# Altium schematic sheet CANable.SchDoc
size A4; SheetNumber: 1; SheetTotal: 1
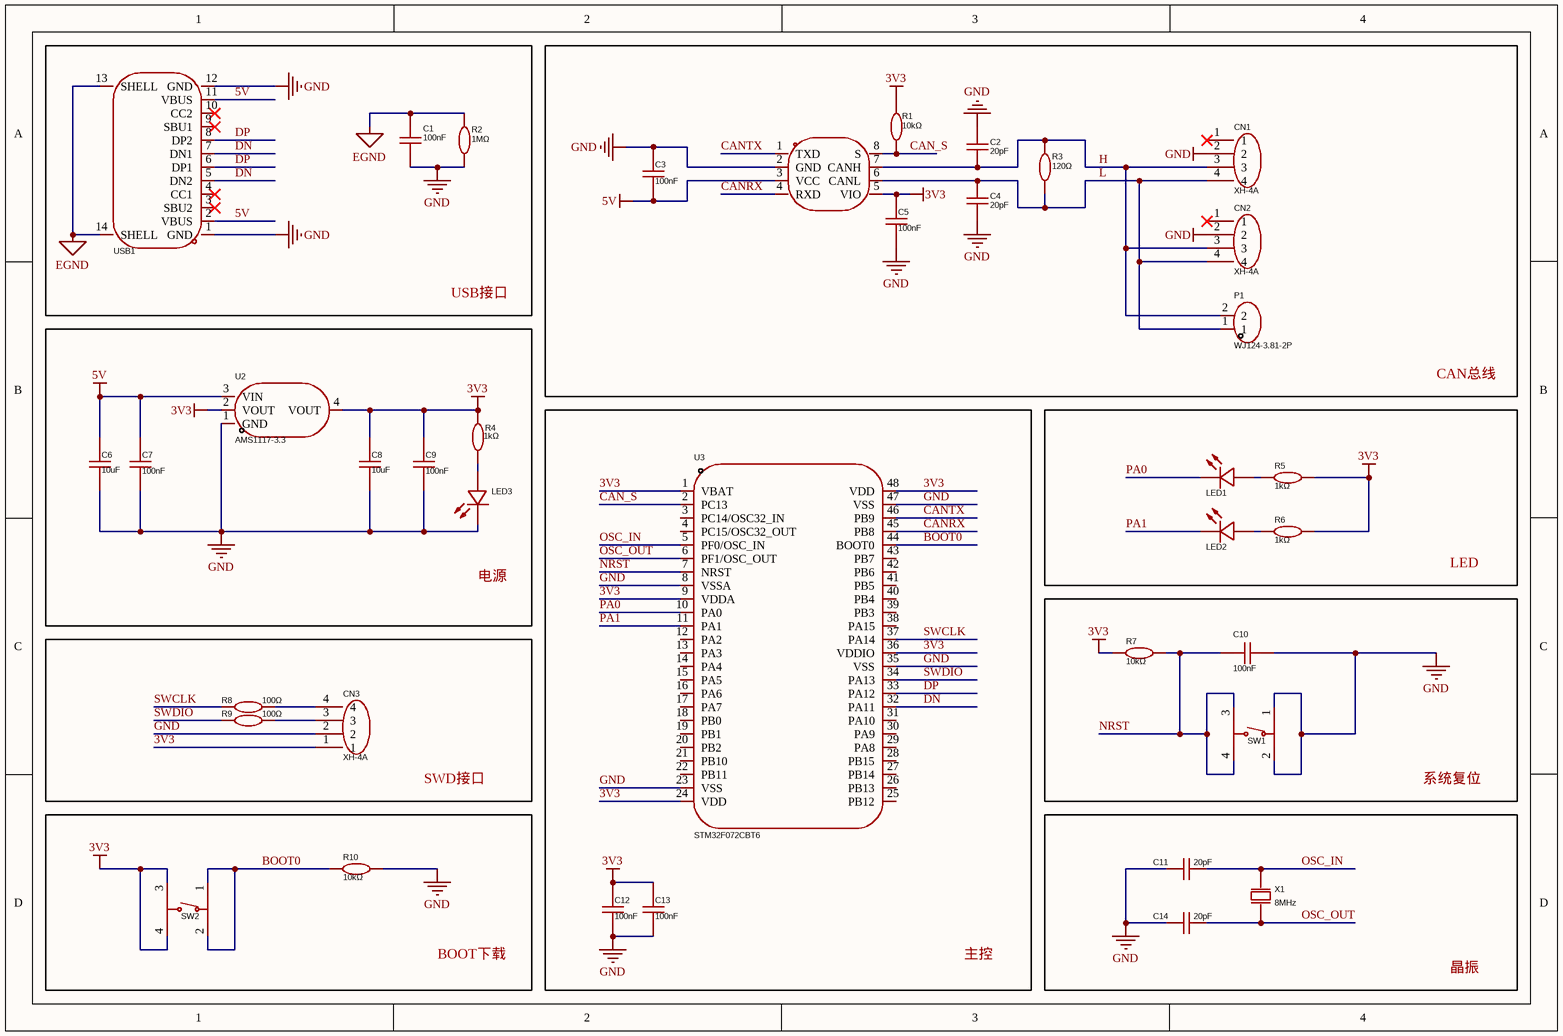
[diagram p0: CANable.SchDoc]

## Parts
C1  100nF  [C0603]
C2  20pF  [C0603]
C3  100nF  [C0603]
C4  20pF  [C0603]
C5  100nF  [C0603]
C6  10uF  [C0805]
C7  100nF  [C0603]
C8  10uF  [C0805]
C9  100nF  [C0603]
C10  100nF  [C0603]
C11  20pF  [C0603]
C12  100nF  [C0603]
C13  100nF  [C0603]
C14  20pF  [C0603]
CN1  XH-4A  [CONN-TH_4P-P2.50_XH-4A]
CN2  XH-4A  [CONN-TH_4P-P2.50_XH-4A]
CN3  XH-4A  [CONN-TH_4P-P2.50_XH-4A]
LED1  KT-0603R  [LED0603-RD]  (value not drawn)
LED2  KT-0603R  [LED0603-RD]  (value not drawn)
LED3  KT-0603R  [LED0603-RD]  (value not drawn)
P1  WJ124-3.81-2P  [CONN-TH_2P-P3.81_KF124-3.81-2P]
R1  10kΩ  [R0603]
R2  1MΩ  [R0603]
R3  120Ω  [R0603]
R4  1kΩ  [R0603]
R5  1kΩ  [R0603]
R6  1kΩ  [R0603]
R7  10kΩ  [R0603]
R8  100Ω  [R0603]
R9  100Ω  [R0603]
R10  10kΩ  [R0603]
SW1  TS-1187A-B-A-B  [SW-SMD_4P-L5.1-W5.1-P3.70-LS6.5-TL_H1.5]  (value not drawn)
SW2  TS-1187A-B-A-B  [SW-SMD_4P-L5.1-W5.1-P3.70-LS6.5-TL_H1.5]  (value not drawn)
U1  TJA1051T/3/1J  [SOIC-8_L4.9-W3.9-P1.27-LS6.0-BL]  (value not drawn)
U2  AMS1117-3.3  [SOT-223-3_L6.5-W3.4-P2.30-LS7.0-BR]
U3  STM32F072CBT6  [LQFP-48_L7.0-W7.0-P0.50-LS9.0-BL]
USB1  TYPE-C 16PIN 2MD(073)  [USB-C-SMD_TYPE-C-6PIN-2MD-073]  (value not drawn)
X1  8MHz  [CRYSTAL-SMD_L5.0-W3.2]

## Blocks framed on the sheet
USB接口: C1 R2 USB1
CAN总线: C2-C5 CN1 CN2 P1 R1 R3 U1
电源: C6-C9 LED3 R4 U2
主控: C12 C13 U3
LED: LED1 LED2 R5 R6
系统复位: C10 R7 SW1
SWD接口: CN3 R8 R9
BOOT下载: R10 SW2
晶振: C11 C14 X1

## Nets
3V3: C5.1 C8.1 C9.1 C12.1 C13.1 CN3.1 R1.2 R4.1 R5.1 R6.1 R7.1 SW2.3(C) SW2.4(D) U1.5(VIO) U2.2(VOUT) U2.4(VOUT) U3.1(VBAT) U3.9(VDDA) U3.24(VDD) U3.36(VDDIO) U3.48(VDD)
5V: C3.2 C6.1 C7.1 U1.3(VCC) U2.3(VIN) USB1.2(VBUS) USB1.11(VBUS)
EGND: C1.1 R2.1 USB1.13(SHELL) USB1.14(SHELL)
GND: C1.2 C2.2 C3.1 C4.1 C5.2 C6.2 C7.2 C8.2 C9.2 C10.2 C11.1 C12.2 C13.2 C14.1 CN1.2 CN2.2 CN3.2 LED3.1(K) R2.2 R10.2 SW1.1(A) SW1.2(B) U1.2(GND) U2.1(GND) U3.8(VSSA) U3.23(VSS) U3.35(VSS) U3.47(VSS) USB1.1(GND) USB1.12(GND)
BOOT0: R10.1 SW2.1(A) SW2.2(B) U3.44(BOOT0)
CAN_S: R1.1 U1.8(S) U3.2(PC13)
CANRX: U1.4(RXD) U3.45(PB8)
CANTX: U1.1(TXD) U3.46(PB9)
DN: U3.32(PA11) USB1.5(DN2) USB1.7(DN1)
DP: U3.33(PA12) USB1.6(DP1) USB1.8(DP2)
H: C2.1 CN1.3 CN2.3 P1.2 R3.1 U1.7(CANH)
L: C4.2 CN1.4 CN2.4 P1.1 R3.2 U1.6(CANL)
NRST: C10.1 R7.2 SW1.3(C) SW1.4(D) U3.7(NRST)
OSC_IN: C11.2 U3.5(PF0/OSC_IN) X1.2(OSC2)
OSC_OUT: C14.2 U3.6(PF1/OSC_OUT) X1.1(OSC1)
PA0: LED1.1(K) U3.10(PA0)
PA1: LED2.1(K) U3.11(PA1)
SWCLK: R8.1 U3.37(PA14)
SWDIO: R9.1 U3.34(PA13)
NetCN3_3: CN3.3 R9.2
NetCN3_4: CN3.4 R8.2
NetLED1_2: LED1.2(A) R5.2
NetLED2_2: LED2.2(A) R6.2
NetLED3_2: LED3.2(A) R4.2

Not connected (* = marked no-connect by the designer): CN1 1*; CN2 1*; U3 3(PC14/OSC32_IN) 4(PC15/OSC32_OUT) 12(PA2) 13(PA3) 14(PA4) 15(PA5) 16(PA6) 17(PA7) 18(PB0) 19(PB1) 20(PB2) 21(PB10) 22(PB11) 25(PB12) 26(PB13) 27(PB14) 28(PB15) 29(PA8) 30(PA9) 31(PA10) 38(PA15) 39(PB3) 40(PB4) 41(PB5) 42(PB6) 43(PB7); USB1 3(SBU2)* 4(CC1)* 9(SBU1)* 10(CC2)*

## Library data of the parts
C1 C3 C5 C7 C9 C10 C12 C13 = CC0603KRX7R9BB104: Manufacturer: YAGEO(国巨); Add into BOM: yes; Tolerance: ±10%; Voltage Rating: 50V; Temperature Coefficient: X7R; Symbol: CC0603KRX7R9BB104; Device: CC0603KRX7R9BB104; LCSC Part Name: 100nF ±10% 50V; Supplier Part: C14663; Manufacturer Part: CC0603KRX7R9BB104; Supplier Footprint: 0603; JLCPCB Part Class: Basic Part; Datasheet: https://atta.szlcsc.com/upload/public/pdf/source/20250214/096C4C206003071F5D32E5F0D8E7F8DF.pdf; Supplier: LCSC; Convert to PCB: yes; Value: 100nF
C2 C4 C11 C14 = CL10C200JB8NNNC: Manufacturer: SAMSUNG(三星); Add into BOM: yes; Tolerance: ±5%; Voltage Rating: 50V; Temperature Coefficient: C0G; Symbol: CL10C200JB8NNNC; Device: CL10C200JB8NNNC; LCSC Part Name: 20pF ±5% 50V; Supplier Part: C1648; Manufacturer Part: CL10C200JB8NNNC; Supplier Footprint: 0603; JLCPCB Part Class: Basic Part; Datasheet: https://item.szlcsc.com/datasheet/CL10C200JB8NNNC/2000.html; Supplier: LCSC; Convert to PCB: yes; Value: 20pF
C6 C8 = CL21A106KAYNNNE_C15850: Manufacturer: SAMSUNG(三星); Add into BOM: yes; Tolerance: ±10%; Voltage Rated: 25V; Temperature Coefficient: X5R; Symbol: CL21A106KAYNNNE; Device: CL21A106KAYNNNE_C15850; LCSC Part Name: 10uF ±10% 25V; Supplier Part: C15850; Manufacturer Part: CL21A106KAYNNNE; Supplier Footprint: 0805; JLCPCB Part Class: Basic Part; Datasheet: https://atta.szlcsc.com/upload/public/pdf/source/20160218/1457707763339.pdf; Supplier: LCSC; Convert to PCB: yes; Value: 10uF
CN1-CN3 = XH-4A_C37815: Manufacturer: BOOMELE(博穆精密); Add into BOM: yes; Pins Structure: 1x4P; Pitch: 2.5mm; Reference Series: XH; Number of PINs Per Row: 4; Symbol: XH-4A; Device: XH-4A_C37815; LCSC Part Name: 1x4P 间距:2.5mm 直插 系列:XH; Supplier Part: C37815; Manufacturer Part: XH-4A; Supplier Footprint: 插件,P=2.5mm; JLCPCB Part Class: Extended Part; Datasheet: https://atta.szlcsc.com/upload/public/pdf/source/20181205/C146112_2CB31444E6250AC61E2A41A9A8391D5F.pdf; Supplier: LCSC; Convert to PCB: yes; Mounting Type: 直插; Number of Pins: 4P; Number of Rows: 1; Row Spacing: -; Current Rating: -; Contact Material: -; Contact Plating: -; Operating Temperature: -; Voltage Rating: -; Plastic Material: -; Flame Retardant Rating: -; Supplementary Features: -; Color: -; Z-Height of the Board: -; X-Length of Bottom Edge on Board (Spacing Line): -; Y-Width of Bottom Edge on Board: -
LED1-LED3 = KT-0603R: Manufacturer: KENTO; Add into BOM: yes; Emitted Color: 红色; Symbol: KT-0603R; Device: KT-0603R; LCSC Part Name: 0603 红灯 高亮; Supplier Part: C2286; Manufacturer Part: KT-0603R; Supplier Footprint: 0603; JLCPCB Part Class: Basic Part; Datasheet: https://atta.szlcsc.com/upload/public/pdf/source/20160616/1466072038404.pdf; Supplier: LCSC; Convert to PCB: yes; Power Dissipation: -; Forward Current: -; Dominant Wavelength: -; Peak Wavelength: -; Diode Configuration: -; Lens Color: -; Color Temperature: -; Viewing Angle: -; Mounting Sytle: -; Operating Temperature: -40℃~+85℃
P1 = WJ124-3.81-2P: Manufacturer: KANGNEX(康奈克斯电气); Add into BOM: yes; Structure: 1x2P; Pitch: 3.81mm; Current Rating (Max): 15A; Voltage Rating (Max): 300V; Wire Gauge - AWG: 14~30; Wire Gauge - mm2: 1.5; Number of PINs Per Row: 2; Symbol: WJ124-3.81-2P; Device: WJ124-3.81-2P; LCSC Part Name: 3.81mm 1x2P 排数:1 每排P数:2 直插; Supplier Part: C69811; Manufacturer Part: WJ124-3.81-2P; Supplier Footprint: 插件,P=3.81mm; JLCPCB Part Class: Extended Part; Datasheet: https://atta.szlcsc.com/upload/public/pdf/source/20191225/C69811_9330EF2523583BB8A7E3F75AE744BFE0.pdf; Supplier: LCSC; Convert to PCB: yes; Color: 绿色; Mounting Style: 直插; Number of Pins: 2P; Number of Rows: 1; Operating Temperature Range: -40℃~+105℃
R1 R7 R10 = 0603WAF1002T5E: Manufacturer: UNI-ROYAL(厚声); Add into BOM: yes; Tolerance: ±1%; Power(Watts): 100mW; Voltage-Supply(Max): 75V; Temperature Coefficient: ±100ppm/℃; Symbol: 0603WAF1002T5E; Device: 0603WAF1002T5E; LCSC Part Name: 厚膜电阻 10kΩ ±1% 100mW; Supplier Part: C25804; Manufacturer Part: 0603WAF1002T5E; Supplier Footprint: 0603; JLCPCB Part Class: Basic Part; Datasheet: https://atta.szlcsc.com/upload/public/pdf/source/20200306/C422600_1E6D84923E4A46A82E41ADD87F860B5C.pdf; Supplier: LCSC; Convert to PCB: yes; Type: 厚膜电阻; Value: 10kΩ; Operating Temperature: -55℃~+155℃
R2 = 0603WAF1004T5E: Manufacturer: UNI-ROYAL(厚声); Add into BOM: yes; Tolerance: ±1%; Power(Watts): 100mW; Overload Voltage (Max): 75V; Temperature Coefficient: ±100ppm/℃; Symbol: 0603WAF1004T5E; Device: 0603WAF1004T5E; LCSC Part Name: 1MΩ ±1% 100mW 厚膜电阻; Supplier Part: C22935; Manufacturer Part: 0603WAF1004T5E; Supplier Footprint: 0603; JLCPCB Part Class: Basic Part; Datasheet: https://atta.szlcsc.com/upload/public/pdf/source/20200306/C422600_1E6D84923E4A46A82E41ADD87F860B5C.pdf; Supplier: LCSC; Convert to PCB: yes; Type: 厚膜电阻; Value: 1MΩ; Operating Temperature Range: -55℃~+155℃
R3 = 0603WAF1200T5E: Manufacturer: UNI-ROYAL(厚声); Add into BOM: yes; Tolerance: ±1%; Power(Watts): 100mW; Overload Voltage (Max): 75V; Temperature Coefficient: ±100ppm/℃; Symbol: 0603WAF1200T5E; Device: 0603WAF1200T5E; LCSC Part Name: 120Ω ±1% 100mW 厚膜电阻; Supplier Part: C22787; Manufacturer Part: 0603WAF1200T5E; Supplier Footprint: 0603; JLCPCB Part Class: Basic Part; Datasheet: https://atta.szlcsc.com/upload/public/pdf/source/20200306/C422600_1E6D84923E4A46A82E41ADD87F860B5C.pdf; Supplier: LCSC; Convert to PCB: yes; Type: 厚膜电阻; Value: 120Ω; Operating Temperature Range: -55℃~+155℃
R4-R6 = 0603WAF1001T5E: Manufacturer: UNI-ROYAL(厚声); Add into BOM: yes; Tolerance: ±1%; Power(Watts): 100mW; Overload Voltage (Max): 75V; Temperature Coefficient: ±100ppm/℃; Symbol: 0603WAF1001T5E; Device: 0603WAF1001T5E; LCSC Part Name: 1kΩ ±1% 100mW 厚膜电阻; Supplier Part: C21190; Manufacturer Part: 0603WAF1001T5E; Supplier Footprint: 0603; JLCPCB Part Class: Basic Part; Datasheet: https://atta.szlcsc.com/upload/public/pdf/source/20200306/C422600_1E6D84923E4A46A82E41ADD87F860B5C.pdf; Supplier: LCSC; Convert to PCB: yes; Type: 厚膜电阻; Value: 1kΩ; Operating Temperature Range: -55℃~+155℃
R8 R9 = 0603WAF1000T5E: Manufacturer: UNI-ROYAL(厚声); Add into BOM: yes; Tolerance: ±1%; Power(Watts): 100mW; Overload Voltage (Max): 75V; Temperature Coefficient: ±200ppm/℃; Symbol: 0603WAF1000T5E; Device: 0603WAF1000T5E; LCSC Part Name: 100Ω ±1% 100mW 厚膜电阻; Supplier Part: C22775; Manufacturer Part: 0603WAF1000T5E; Supplier Footprint: 0603; JLCPCB Part Class: Basic Part; Datasheet: https://atta.szlcsc.com/upload/public/pdf/source/20200306/C422600_1E6D84923E4A46A82E41ADD87F860B5C.pdf; Supplier: LCSC; Convert to PCB: yes; Type: 厚膜电阻; Value: 100Ω; Operating Temperature Range: -55℃~+155℃
SW1 SW2 = TS-1187A-B-A-B: Manufacturer: XKB Connectivity(中国星坤); Add into BOM: yes; Circuit: 单刀单掷; Actuator Style: 圆形按钮; Operating Force: 160gf; Switch Length: 5.1mm; Switch Height: 1.5mm; Strike Gundam: 不带; Contact Current: 50mA; Voltage Rating (DC): 12V; Actuator/Cap Color: 金色; With Lamp: 无; Mechanical Life: 10万次; Symbol: TS-1187A-B-A-B; Device: TS-1187A-B-A-B; LCSC Part Name: 5.1*5.1*1.5mm 立贴 轻触开关; Supplier Part: C318884; Manufacturer Part: TS-1187A-B-A-B; Supplier Footprint: SMD; JLCPCB Part Class: Basic Part; Datasheet: https://atta.szlcsc.com/upload/public/pdf/source/20200227/C318890_053E50208A88A7BA1965D8746000774E.pdf; Supplier: LCSC; Convert to PCB: yes; Mounting Style: 立贴; Switch Width: 5.1mm; Insulation Resistance: -; Operating Temperature: -30℃~+85℃
U1 = TJA1051T/3/1J: Manufacturer: NXP(恩智浦); Add into BOM: yes; Data Rate: 5Mbps; Supply Voltage: 4.5V~5.5V; Supply Current: 5mA; Symbol: TJA1051T/3/1J; Device: TJA1051T/3/1J; LCSC Part Name: TJA1051T/3/1J; Supplier Part: C38695; Manufacturer Part: TJA1051T/3/1J; Supplier Footprint: SOIC-8-150mil; JLCPCB Part Class: Extended Part; Datasheet: https://www.nxp.com/docs/en/data-sheet/TJA1051.pdf; Supplier: LCSC; Convert to PCB: yes; Type: -; Operating Temperature: -40℃~+150℃
U2 = AMS1117-3.3_C6186: Manufacturer: AMS; Add into BOM: yes; Output Type: 固定; Voltage - Supply: 16V; Output Voltage: 3.3V; Output Current: 1A; Power Supply Rejection Ratio (PSRR): 72dB@(120Hz); Voltage Dropout: 1.1V@(800mA); standby current: 5mA; Output Configuration: 正极; Number of Outputs: 1; Symbol: AMS1117-3.3; Device: AMS1117-3.3_C6186; LCSC Part Name: 输出3.3V 1A; Supplier Part: C6186; Manufacturer Part: AMS1117-3.3; Supplier Footprint: SOT-223; JLCPCB Part Class: Basic Part; Datasheet: https://item.szlcsc.com/datasheet/AMS1117-3.3/6652.html; Supplier: LCSC; Convert to PCB: yes; Noise: -; Features: 过流保护；过热保护; Operating Temperature: -40℃~+125℃
U3 = STM32F072CBT6: Manufacturer: ST(意法半导体); Add into BOM: yes; CPU Core: ARM-M0; CPU Maximum Speed: 48MHz; Program Storage Size: 128KB; Program Memory Type: FLASH; Number of I/O: 37; ADC (Bit): 12bit; Voltage - Supply: 1.65V~3.6V; Symbol: STM32F072CBT6; Device: STM32F072CBT6; LCSC Part Name: 主流ARM Cortex-M0 USB系列MCU，具有128 KB Flash、48 MHz CPU、USB、CAN和CEC功能; Supplier Part: C81720; Manufacturer Part: STM32F072CBT6; Supplier Footprint: LQFP-48(7x7); JLCPCB Part Class: Extended Part; Datasheet: https://atta.szlcsc.com/upload/public/pdf/source/20171102/C125825_15096092762561078351.pdf; Supplier: LCSC; Convert to PCB: yes; DAC (Bit): 12bit; Applications: -
USB1 = TYPE-C 16PIN 2MD(073): Manufacturer: SHOU HAN(首韩); Add into BOM: yes; Protocol Standard: USB 3.1; Gender: 母; Number of Contacts: 16P; Number of Ports: 1; Current Rating-Power: 3A; Voltage Rating: 5V; Connect-Disconnect Life: 5千次; Detection color: 黑色; Symbol: TYPE-C 16PIN 2MD(073); Device: TYPE-C 16PIN 2MD(073); LCSC Part Name: Type-C 母 卧贴; Supplier Part: C2765186; Manufacturer Part: TYPE-C 16PIN 2MD(073); Supplier Footprint: SMD; JLCPCB Part Class: Extended Part; Datasheet: https://item.szlcsc.com/datasheet/TYPE-C%252016PIN%25202MD(073)/2901843.html; Supplier: LCSC; Convert to PCB: yes; Connector Type: Type-C; Mounting Type: 卧贴; Supplementary Features: -; Center Height: -; Length: -; Operating Temperature: -25℃~+85℃
X1 = X50328MSB2GI: Manufacturer: YXC(扬兴晶振); Add into BOM: yes; Normal temperature Frequency Tolerance: ±10ppm; Load Capacitance: 20pF; Frequency Stability: ±20ppm; Symbol: X50328MSB2GI; Device: X50328MSB2GI; LCSC Part Name: YSX530GA 8MHZ 2P 5032 20PF ±10PPM -40~85℃ (±20PPM); Supplier Part: C115962; Manufacturer Part: X50328MSB2GI; Supplier Footprint: SMD5032-2P; JLCPCB Part Class: Basic Part; Datasheet: https://item.szlcsc.com/datasheet/X50328MSB2GI/117214.html; Supplier: LCSC; Convert to PCB: yes; Type: 贴片晶振; Value: 8MHz; Operating Temperature: -40℃~+85℃